# Altium schematic sheet Sensor.SchDoc
size A4; SheetNumber: 4; SheetTotal: 5
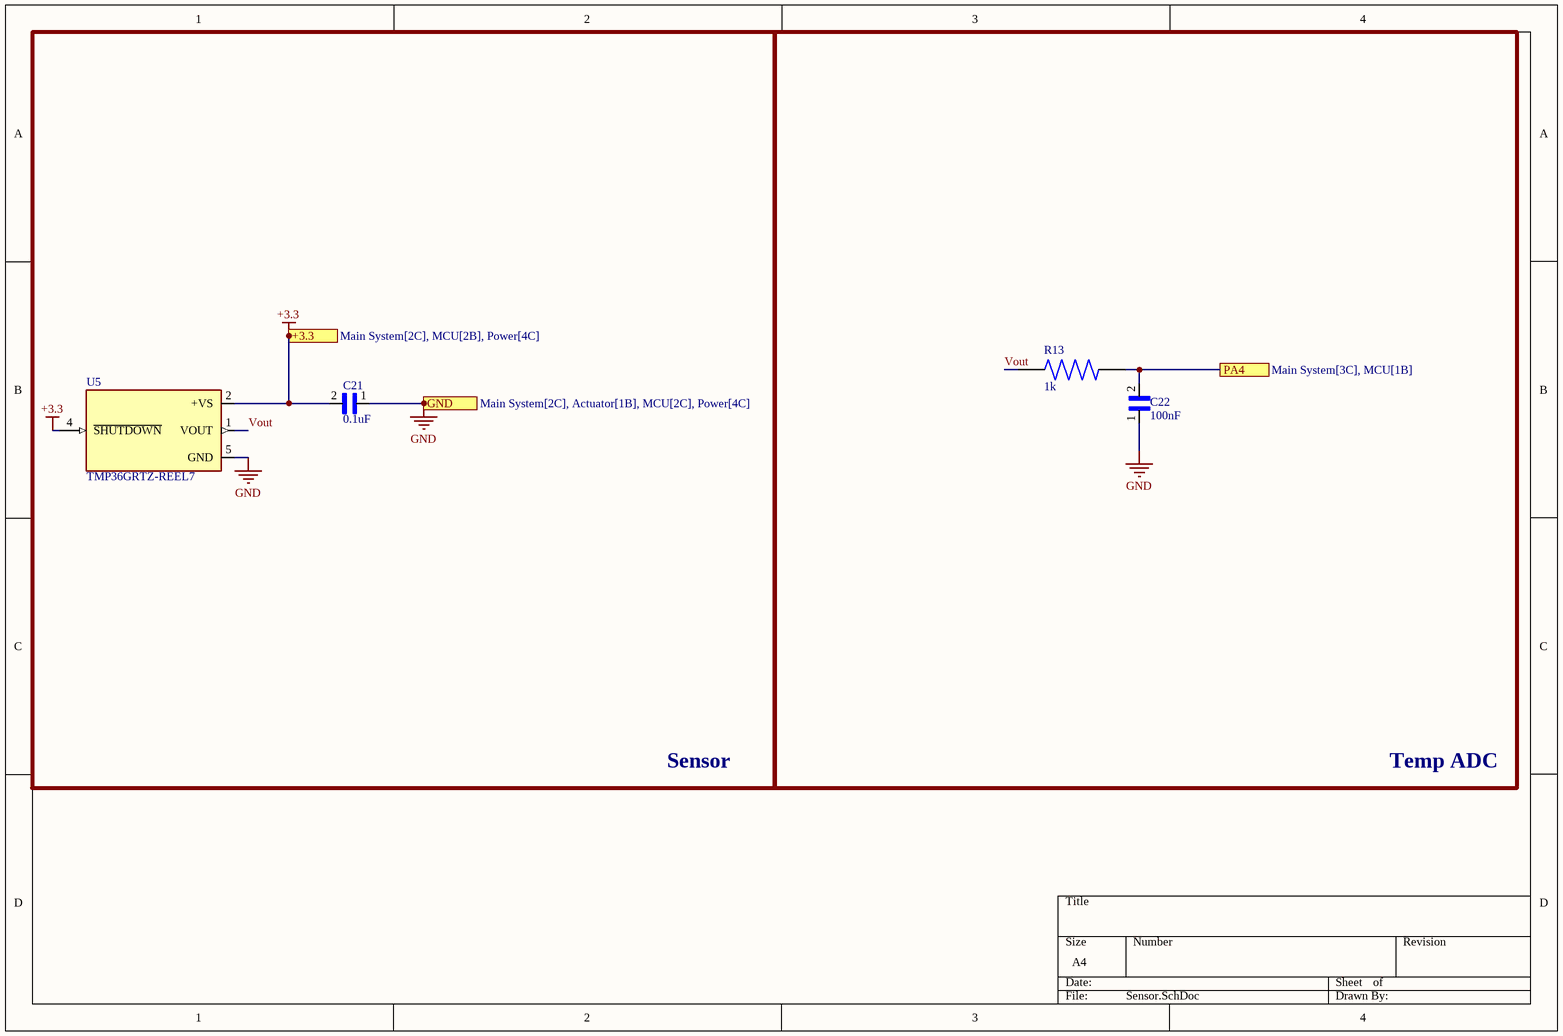
[diagram p0: Sensor.SchDoc]

## Parts
C21  0.1uF  [CAPC1608X90N]
C22  100nF  [CAPC1608X90N]
R13  1k  [RESC1005X40N]
U5  TMP36GRTZ-REEL7  [SOT95P280X145-5N]

## Blocks framed on the sheet
Sensor: C21 U5
Temp ADC: C22 R13

## Ports
+3.3 (see Main System[2C], MCU[2B], Power[4C]), GND (see Main System[2C], Actuator[1B], MCU[2C], Power[4C]), PA4 (see Main System[3C], MCU[1B])

## Nets
+3.3: C21.2 U5.2(+VS) U5.4(~{SHUTDOWN}) ; port +3.3
GND: C21.1 C22.1 U5.5(GND) ; port GND
PA4: C22.2 R13.2 ; port PA4
Vout: R13.1 U5.1(VOUT)

## Library data of the parts
C21 C22 = CGA3E2X7R1H104K080AA: 0.1ÂµF Â±10% 50V Ceramic Capacitor X7R 0603 (1608 Metric); MF: TDK; SnapEDA_Link: https://www.snapeda.com/parts/CGA3E2X7R1H104K080AA/TDK-Lambda+Americas+Inc/view-part/?ref=snap; Package: 1608 TDK; Value: *; MP: CGA3E2X7R1H104K080AA; Check_prices: https://www.snapeda.com/parts/CGA3E2X7R1H104K080AA/TDK-Lambda+Americas+Inc/view-part/?ref=eda; Purchase-URL: https://pricing.snapeda.com/search/part/CGA3E2X7R1H104K080AA/?ref=eda
R13 = CRCW040210K0FKED: Resistor;Thick Film;10 Kilohms;0.063 W;1%;SMT;0402;TCR 37 ppm/DegC;Tape and Reel | Vishay Dale CRCW040210K0FKED; SnapEDA_Link: https://www.snapeda.com/parts/CRCW040210K0FKED/Dale/view-part/?ref=snap; Package: Package; Value: *; MF: Vishay Dale; MP: CRCW040210K0FKED; Check_prices: https://www.snapeda.com/parts/CRCW040210K0FKED/Dale/view-part/?ref=eda
U5 = TMP36GRTZ-REEL7: Voltage Output Temperature Sensors; MF: Analog Devices; SnapEDA_Link: https://www.snapeda.com/parts/TMP36GRTZ-REEL7/Analog+Devices/view-part/?ref=snap; Package: SOT-5 Analog Devices; Value: *; MP: TMP36GRTZ-REEL7; Check_prices: https://www.snapeda.com/parts/TMP36GRTZ-REEL7/Analog+Devices/view-part/?ref=eda